# Altium schematic sheet Sheet_1_2026-11-12.schdoc
size 729 x 538 mm
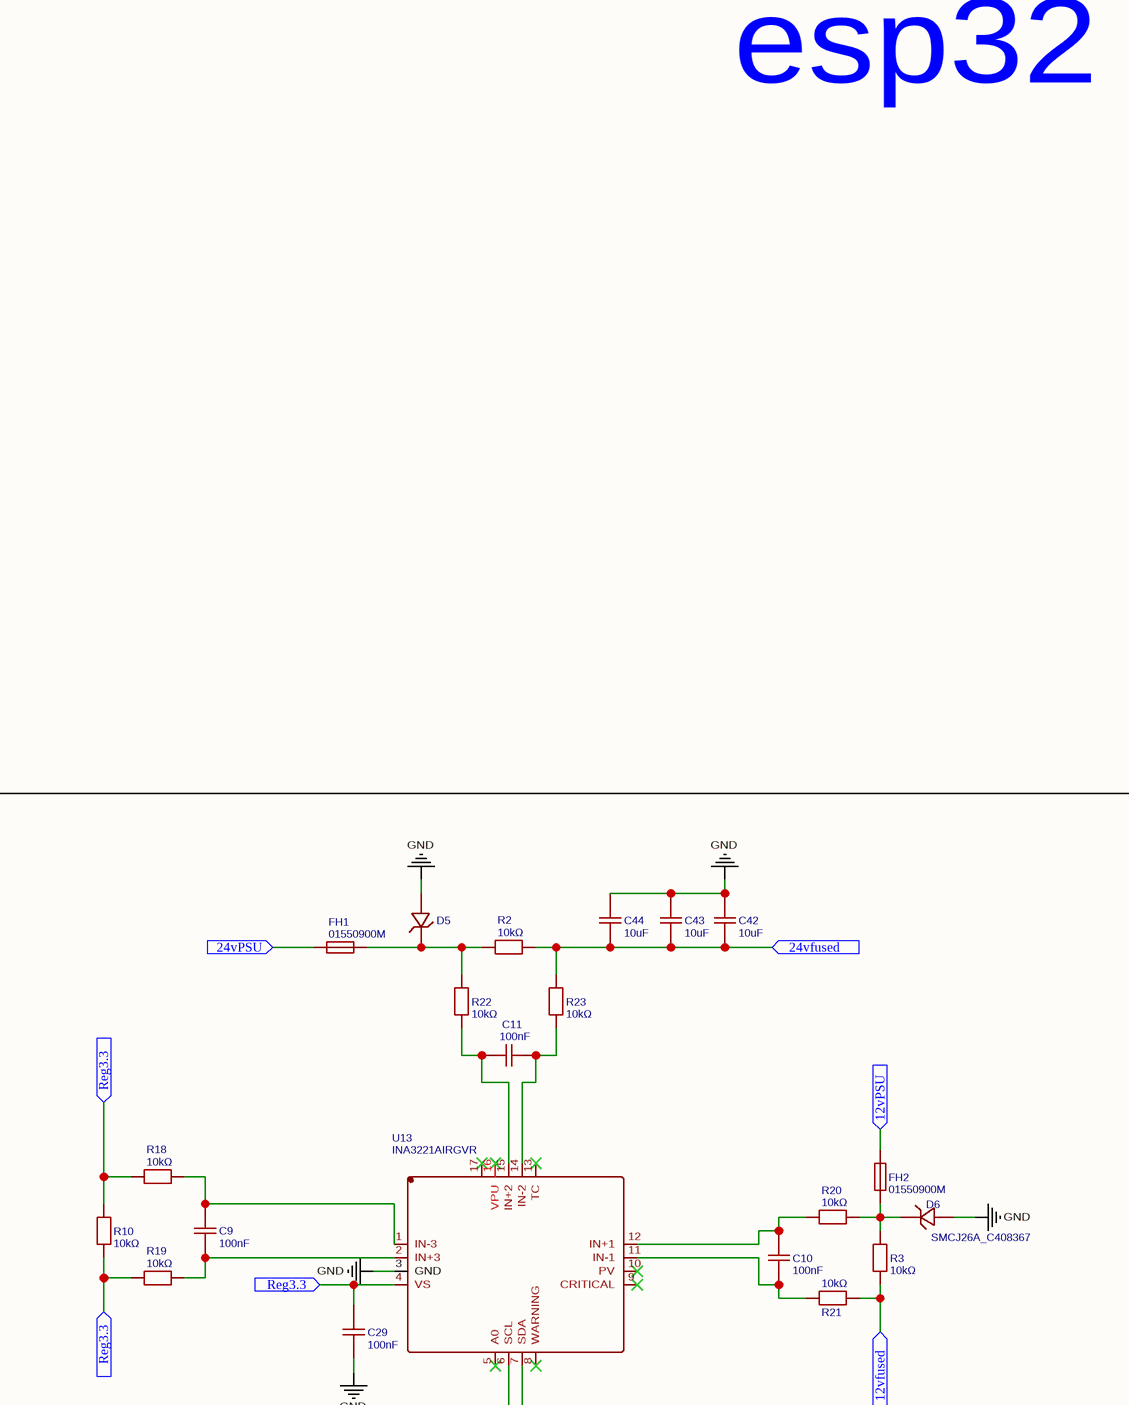
[diagram p0: Sheet_1_2026-11-12.schdoc, top left]
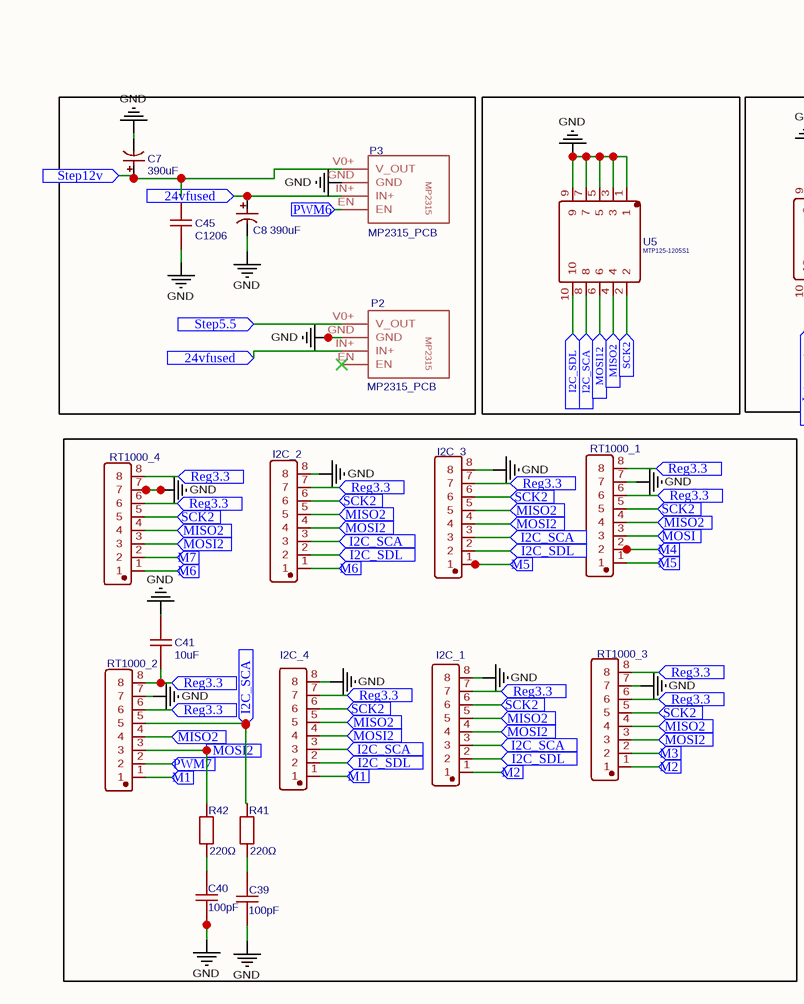
[diagram p1: Sheet_1_2026-11-12.schdoc, top middle]
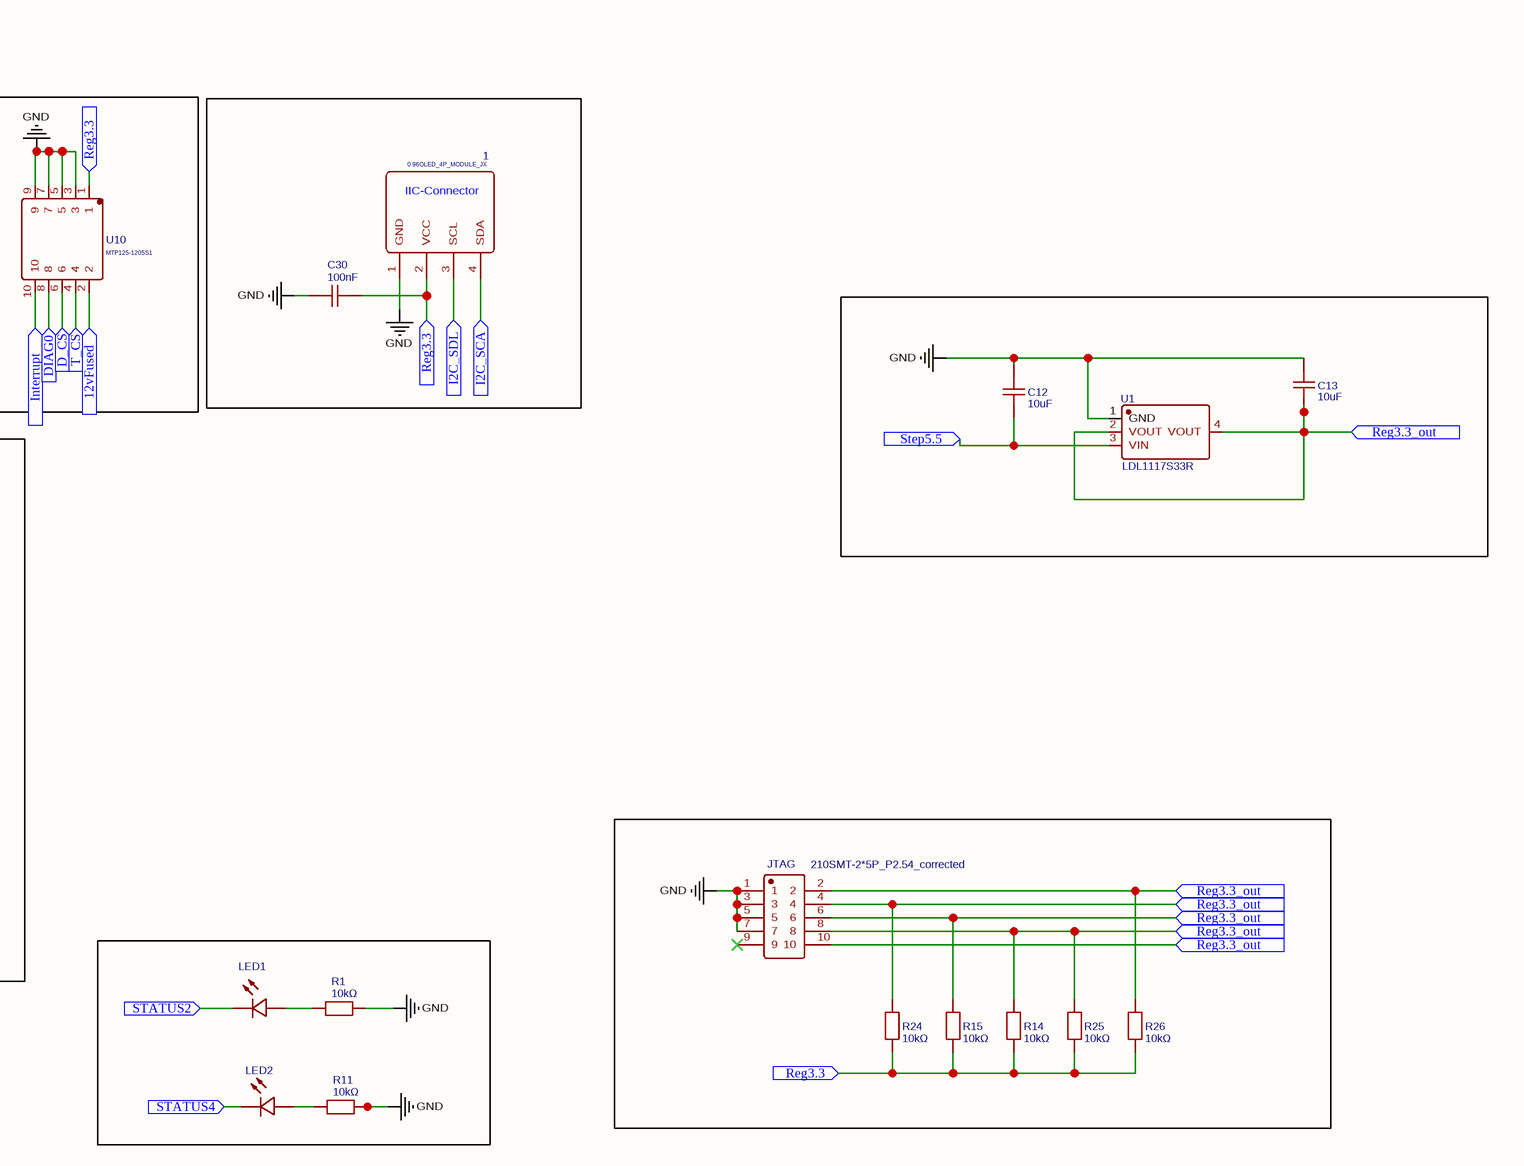
[diagram p2: Sheet_1_2026-11-12.schdoc, top right]
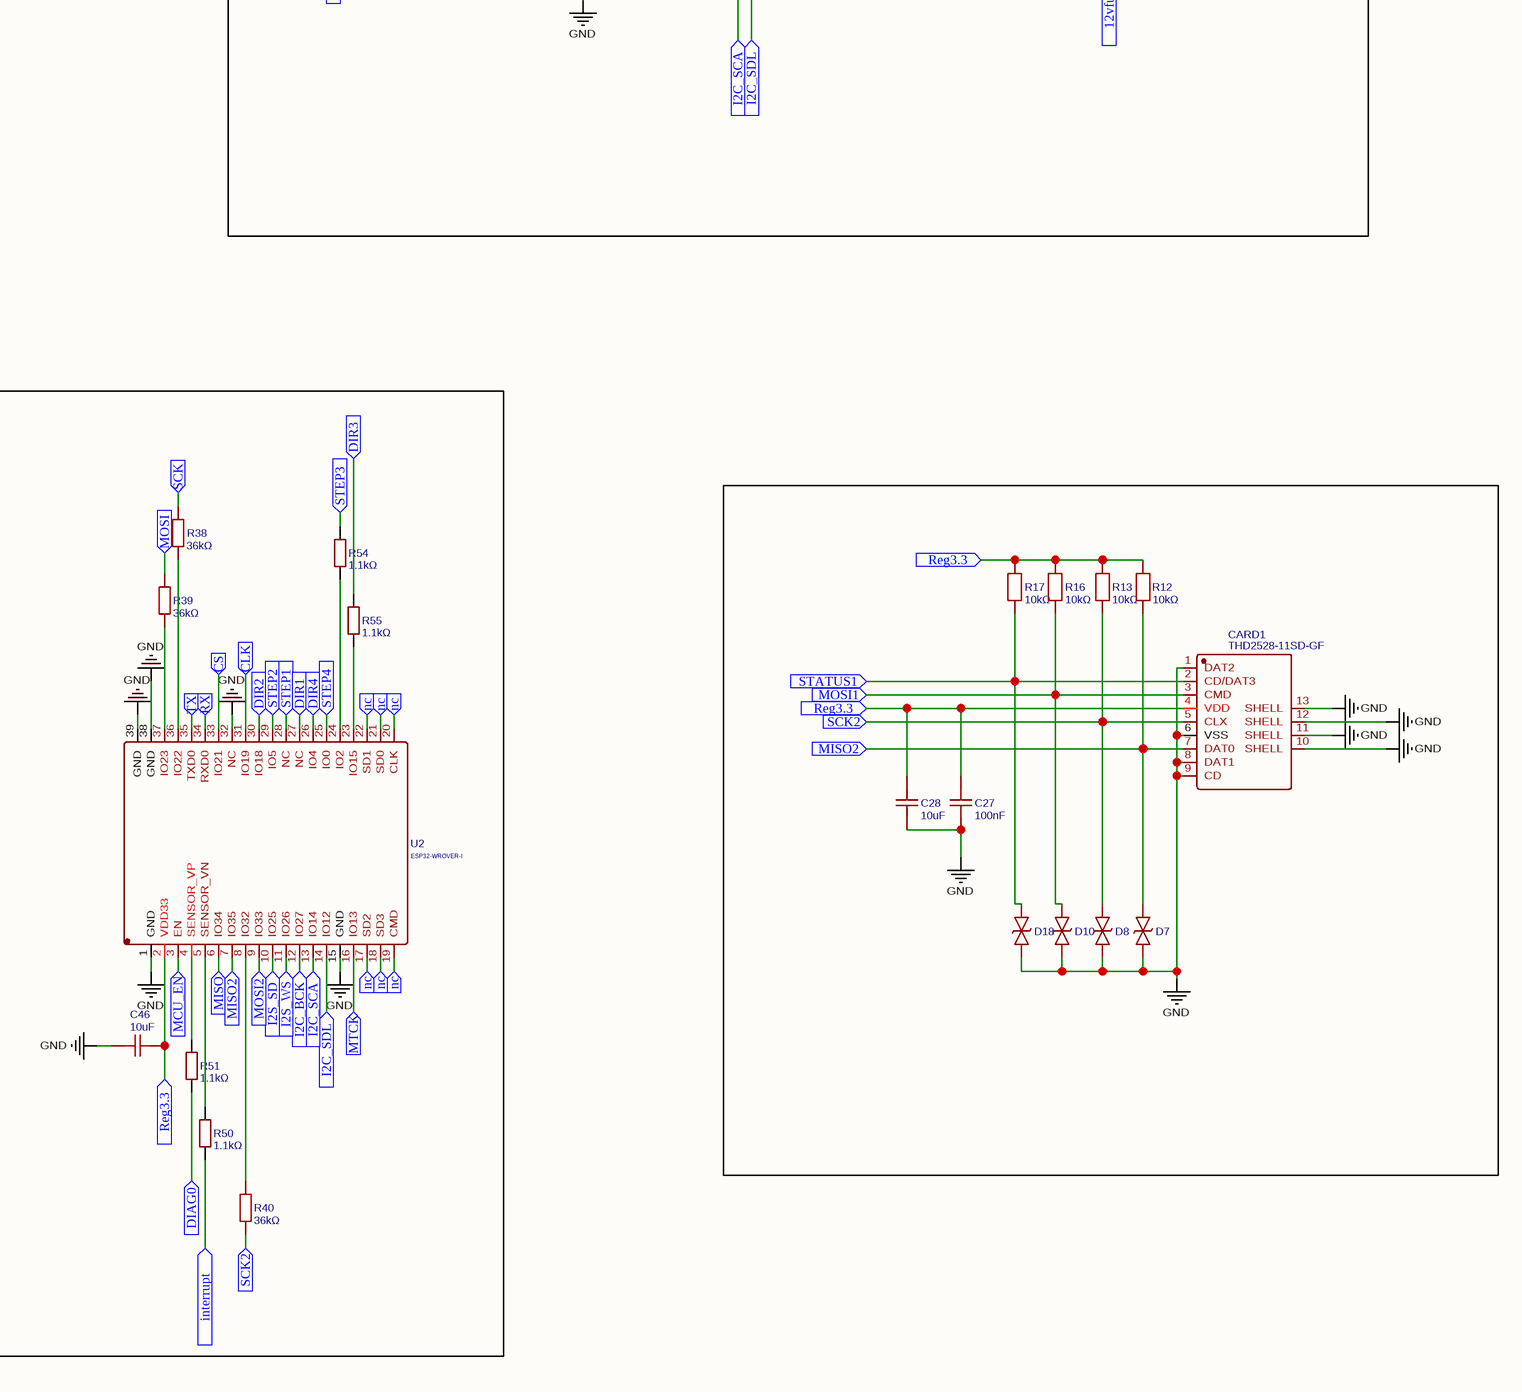
[diagram p3: Sheet_1_2026-11-12.schdoc, bottom left]
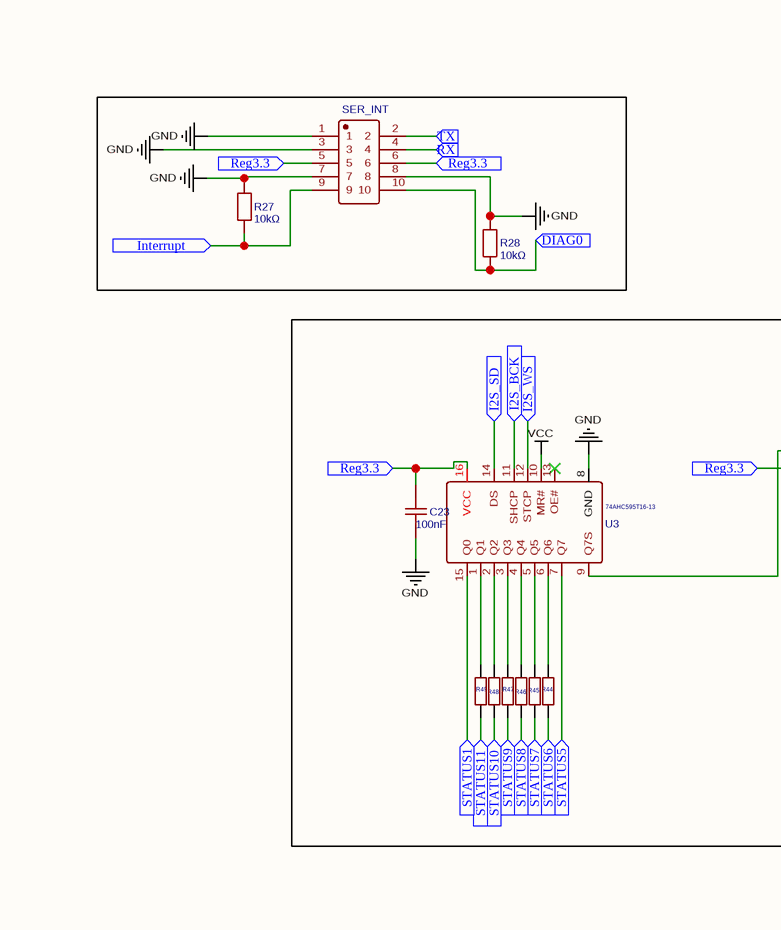
[diagram p4: Sheet_1_2026-11-12.schdoc, bottom middle]
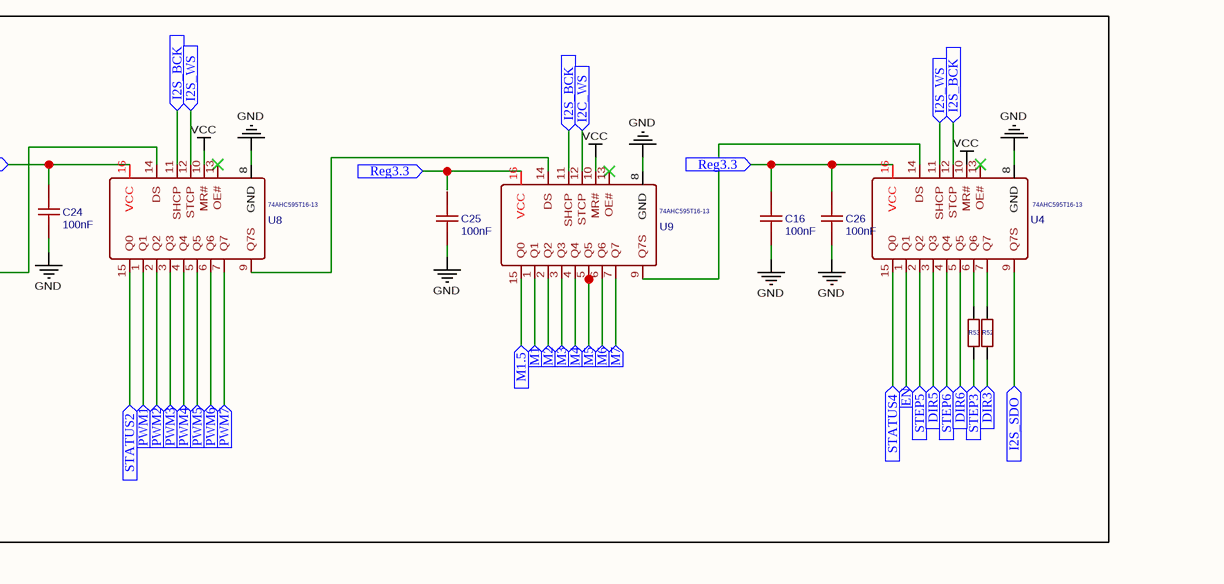
[diagram p5: Sheet_1_2026-11-12.schdoc, bottom right]

## Parts
1  0.96OLED_4P_MODULE_JX  [0.96OLED_4P]
C7  390uF  [CAP-TH_BD10.0-P5.00-D1.0-FD]
C8  390uF  [CAP-TH_BD10.0-P5.00-D1.0-FD]
C9  100nF  [C0402]
C10  100nF  [C0402]
C11  100nF  [C0402]
C12  10uF  [C1206]
C13  10uF  [C1206]
C16  100nF  [C0402]
C23  100nF  [C0402]
C24  100nF  [C0402]
C25  100nF  [C0402]
C26  100nF  [C0402]
C27  100nF  [C0402]
C28  10uF  [C0402]
C29  100nF  [C0402]
C30  100nF  [C0402]
C39  100pF  [C0402]
C40  100pF  [C0402]
C41  10uF  [C0402]
C42  10uF  [C0402]
C43  10uF  [C0402]
C44  10uF  [C0402]
C45  C1206  [C1206]
C46  10uF  [C1206]
CARD1  THD2528-11SD-GF  [TF-SMD_THD2528-11SD-GF]
D5  SMCJ26A_C408367  [SMC_L6.9-W5.9-LS7.9-RD]  (value not drawn)
D6  SMCJ26A_C408367  [SMC_L6.9-W5.9-LS7.9-RD]
D7  SMF26CA_C435495  [SOD-123_L2.8-W1.8-LS3.7-BI]  (value not drawn)
D8  SMF26CA_C435495  [SOD-123_L2.8-W1.8-LS3.7-BI]  (value not drawn)
D10  SMF26CA_C435495  [SOD-123_L2.8-W1.8-LS3.7-BI]  (value not drawn)
D18  SMF26CA_C435495  [SOD-123_L2.8-W1.8-LS3.7-BI]  (value not drawn)
FH1  01550900M  [FUSE-SMD_L9.8-W5.0_01550900M]
FH2  01550900M  [FUSE-SMD_L9.8-W5.0_01550900M]
I2C_1  MTF185-108SY1  [HDR-TH_8P-P2.54-V-F-1]  (value not drawn)
I2C_2  MTF185-108SY1  [HDR-TH_8P-P2.54-V-F-1]  (value not drawn)
I2C_3  MTF185-108SY1  [HDR-TH_8P-P2.54-V-F-1]  (value not drawn)
I2C_4  MTF185-108SY1  [HDR-TH_8P-P2.54-V-F-1]  (value not drawn)
JTAG  210SMT-2*5P_P2.54_corrected  [HDR-SMD_10P-P2.54-V-M-R2-C5-S2.54-LS7.3]
LED1  19-217/B7C-ZL2N1B3X/3T  [LED0603-R-RD_BLUE]  (value not drawn)
LED2  19-217/B7C-ZL2N1B3X/3T  [LED0603-R-RD_BLUE]  (value not drawn)
P2  MP2315_PCB  [MP2315_PCB]
P3  MP2315_PCB  [MP2315_PCB]
R1  10kΩ  [R0402]
R2  10kΩ  [R0402]
R3  10kΩ  [R0402]
R10  10kΩ  [R0402]
R11  10kΩ  [R0402]
R12  10kΩ  [R0402]
R13  10kΩ  [R0402]
R14  10kΩ  [R0402]
R15  10kΩ  [R0402]
R16  10kΩ  [R0402]
R17  10kΩ  [R0402]
R18  10kΩ  [R0402]
R19  10kΩ  [R0402]
R20  10kΩ  [R0402]
R21  10kΩ  [R0402]
R22  10kΩ  [R0402]
R23  10kΩ  [R0402]
R24  10kΩ  [R0402]
R25  10kΩ  [R0402]
R26  10kΩ  [R0402]
R27  10kΩ  [R0402]
R28  10kΩ  [R0402]
R38  36kΩ  [R0603]
R39  36kΩ  [R0603]
R40  36kΩ  [R0603]
R41  220Ω  [R0402]
R42  220Ω  [R0402]
R44  1.1kΩ  [R0402]  (value not drawn)
R45  1.1kΩ  [R0402]  (value not drawn)
R46  1.1kΩ  [R0402]  (value not drawn)
R47  1.1kΩ  [R0402]  (value not drawn)
R48  1.1kΩ  [R0402]  (value not drawn)
R49  1.1kΩ  [R0402]  (value not drawn)
R50  1.1kΩ  [R0402]
R51  1.1kΩ  [R0402]
R52  1.1kΩ  [R0402]  (value not drawn)
R53  1.1kΩ  [R0402]  (value not drawn)
R54  1.1kΩ  [R0402]
R55  1.1kΩ  [R0402]
RT1000_1  MTF185-108SY1  [HDR-TH_8P-P2.54-V-F-1]  (value not drawn)
RT1000_2  MTF185-108SY1  [HDR-TH_8P-P2.54-V-F-1]  (value not drawn)
RT1000_3  MTF185-108SY1  [HDR-TH_8P-P2.54-V-F-1]  (value not drawn)
RT1000_4  MTF185-108SY1  [HDR-TH_8P-P2.54-V-F-1]  (value not drawn)
SER_INT  210SMT-2*5P_P2.54_corrected  [HDR-SMD_10P-P2.54-V-M-R2-C5-S2.54-LS7.3]  (value not drawn)
U1  LDL1117S33R  [SOT-223-4_L6.5-W3.5-P2.30-LS7.0-BR]
U2  ESP32-WROVER-I  [WIFIM-SMD_ESP32-WROVER-I]
U3  74AHC595T16-13  [TSSOP-16_L5.0-W4.4-P0.65-LS6.4-BL]
U4  74AHC595T16-13  [TSSOP-16_L5.0-W4.4-P0.65-LS6.4-BL]
U5  MTP125-1205S1  [HDR-TH_10P-P2.54-V-M-R2-C5-S2.54]
U8  74AHC595T16-13  [TSSOP-16_L5.0-W4.4-P0.65-LS6.4-BL]
U9  74AHC595T16-13  [TSSOP-16_L5.0-W4.4-P0.65-LS6.4-BL]
U10  MTP125-1205S1  [HDR-TH_10P-P2.54-V-M-R2-C5-S2.54]
U13  INA3221AIRGVR  [QFN-16_L4.0-W4.0-P0.65-TL-EP2.2]

## Ports
12vfused (in), 12vFused (in), 12vPSU (in), 24vfused (in), 24vPSU (in), CLK (in), CS (in), D_CS (in), DIAG0 (in), DIR1 (in), DIR2 (in), DIR3 (in), DIR4 (in), DIR5 (in), DIR6 (in), EN (in), I2C_BCK (in), I2C_SCA (in), I2C_SDL (in), I2C_WS (in), I2S_BCK (in), I2S_SD (in), I2S_SDO (in), I2S_WS (in), interrupt (in), Interrupt (in), M1 (in), M1.5 (in), M2 (in), M3 (in), M4 (in), M5 (in), M6 (in), M7 (in), MCU_EN (in), MISO2 (in), MISO (in), MOSI1 (in), MOSI2 (in), MOSI12 (in), MOSI (in), MTCK (in), nc (in), PWM1 (in), PWM2 (in), PWM3 (in), PWM4 (in), PWM5 (in), PWM6 (in), PWM7 (in), Reg3.3 (in), Reg3.3_out (in), RX (in), SCK2 (in), SCK (in), STATUS1 (in), STATUS2 (in), STATUS4 (in), STATUS5 (in), STATUS6 (in), STATUS7 (in), STATUS8 (in), STATUS9 (in), STATUS10 (in), STATUS11 (in), STEP1 (in), STEP2 (in), STEP3 (in), STEP4 (in), STEP5 (in), Step5.5 (in), STEP6 (in), Step12v (in), T_CS (in), TX (in)

## Nets
GND: 1.1(GND) C7.2 C8.2 C12.2 C13.2 C16.1 C23.1 C24.1 C25.1 C26.1 C27.1 C28.2 C29.1 C30.1 C39.2 C40.2 C41.2 C42.2 C43.2 C44.2 C45.2 C46.1 CARD1.1(DAT2) CARD1.6(VSS) CARD1.8(DAT1) CARD1.9(CD) CARD1.10(SHELL) CARD1.11(SHELL) CARD1.12(SHELL) CARD1.13(SHELL) D5.2(A) D6.2(A) D7.1 D8.1 D10.1 D18.1 I2C_1.8 I2C_2.8 I2C_3.8 I2C_4.8 JTAG.1 JTAG.3 JTAG.5 JTAG.7 P2.GND P3.GND R1.2 R11.2 R27.2 R28.1 RT1000_1.7 RT1000_2.7 RT1000_3.7 RT1000_4.7 SER_INT.1 SER_INT.3 SER_INT.7 SER_INT.8 U1.1(GND) U2.1(GND) U2.15(GND) U2.32(NC) U2.38(GND) U2.39(GND) U3.8(GND) U4.8(GND) U5.1 U5.3 U5.5 U5.7 U5.9 U8.8(GND) U9.8(GND) U10.3 U10.5 U10.7 U10.9 U13.3(GND)
VCC: U3.10(MR#) U4.10(MR#) U8.10(MR#) U9.10(MR#)
12vfused: R3.2 R21.1 U10.2 ; port 12vfused, port 12vFused
12vPSU: FH2.1 ; port 12vPSU
24vfused: C8.1 C42.1 C43.1 C44.1 P2.IN+ P3.IN+ R2.2 R23.1 ; port 24vfused
24vPSU: FH1.1 ; port 24vPSU
CLK: U2.31(IO19) ; port CLK
CS: U2.33(IO21) ; port CS
D_CS: U10.6 ; port D_CS
DIAG0: R28.2 R51.1 SER_INT.10 U10.8 ; port DIAG0
DIR1: U2.27(NC) ; port DIR1
DIR2: U2.30(IO18) ; port DIR2
DIR3: R52.1 R55.2 ; port DIR3
DIR4: U2.26(IO4) ; port DIR4
DIR5: U4.3(Q3) ; port DIR5
DIR6: U4.5(Q5) ; port DIR6
EN: U4.1(Q1) ; port EN
I2C_BCK: U2.12(IO27) ; port I2C_BCK
I2C_SCA: 1.4(SDA) I2C_1.3 I2C_2.3 I2C_3.3 I2C_4.3 R41.1 RT1000_2.5 U2.13(IO14) U5.8 U13.6(SCL) ; port I2C_SCA
I2C_SDL: 1.3(SCL) I2C_1.2 I2C_2.2 I2C_3.2 I2C_4.2 U2.14(IO12) U5.10 U13.7(SDA) ; port I2C_SDL
I2C_WS: U9.12(STCP) ; port I2C_WS
I2S_BCK: U3.11(SHCP) U4.12(STCP) U8.11(SHCP) U9.11(SHCP) ; port I2S_BCK
I2S_SD: U2.10(IO25) U3.14(DS) ; port I2S_SD
I2S_SDO: U4.9(Q7S) ; port I2S_SDO
I2S_WS: U2.11(IO26) U3.12(STCP) U4.11(SHCP) U8.12(STCP) ; port I2S_WS
interrupt: R27.1 R50.1 SER_INT.9 U10.10 ; port interrupt, port Interrupt
M1: I2C_4.1 RT1000_2.1 U9.1(Q1) ; port M1
M1.5: U9.15(Q0) ; port M1.5
M2: I2C_1.1 RT1000_3.1 U9.2(Q2) ; port M2
M3: RT1000_3.2 U9.3(Q3) ; port M3
M4: RT1000_1.2 U9.4(Q4) ; port M4
M5: I2C_3.1 RT1000_1.1 U9.5(Q5) ; port M5
M6: I2C_2.1 RT1000_4.1 U9.6(Q6) ; port M6
M7: RT1000_4.2 U9.7(Q7) ; port M7
MCU_EN: U2.3(EN) ; port MCU_EN
MISO: U2.6(IO34) ; port MISO
MISO2: CARD1.7(DAT0) D7.2 I2C_1.5 I2C_2.5 I2C_3.5 I2C_4.5 R12.2 RT1000_1.4 RT1000_2.4 RT1000_3.4 RT1000_4.4 U2.7(IO35) U5.4 ; port MISO2
MOSI: R39.2 RT1000_1.3 ; port MOSI
MOSI1: CARD1.3(CMD) D10.2 R16.2 ; port MOSI1
MOSI2: I2C_1.4 I2C_2.4 I2C_3.4 I2C_4.4 R42.1 RT1000_2.3 RT1000_3.3 RT1000_4.3 U2.9(IO33) ; port MOSI2
MOSI12: U5.6 ; port MOSI12
MTCK: U2.16(IO13) ; port MTCK
nc: U2.17(SD2) U2.18(SD3) U2.19(CMD) U2.20(CLK) U2.21(SD0) U2.22(SD1) ; port nc
PWM1: U8.1(Q1) ; port PWM1
PWM2: U8.2(Q2) ; port PWM2
PWM3: U8.3(Q3) ; port PWM3
PWM4: U8.4(Q4) ; port PWM4
PWM5: U8.5(Q5) ; port PWM5
PWM6: P3.EN U8.6(Q6) ; port PWM6
PWM7: RT1000_2.2 U8.7(Q7) ; port PWM7
Reg3.3: 1.2(VCC) C16.2 C23.2 C24.2 C26.2 C27.2 C28.1 C29.2 C30.2 C41.1 C46.2 CARD1.4(VDD) I2C_1.7 I2C_2.7 I2C_3.7 I2C_4.7 R10.1 R10.2 R12.1 R13.1 R14.1 R15.1 R16.1 R17.1 R18.2 R19.2 R24.2 R25.1 R26.1 RT1000_1.6 RT1000_1.8 RT1000_2.6 RT1000_2.8 RT1000_3.6 RT1000_3.8 RT1000_4.6 RT1000_4.8 SER_INT.5 SER_INT.6 U2.2(VDD33) U3.16(VCC) U4.16(VCC) U8.16(VCC) U9.16(VCC) U10.1 U13.4(VS) ; port Reg3.3
Reg3.3_out: C13.1 JTAG.2 JTAG.4 JTAG.6 JTAG.8 JTAG.10 R14.2 R15.2 R24.1 R25.2 R26.2 U1.2(VOUT) U1.4(VOUT) ; port Reg3.3_out
RX: SER_INT.4 U2.34(RXD0) ; port RX
SCK: R38.2 ; port SCK
SCK2: CARD1.5(CLX) D8.2 I2C_1.6 I2C_2.6 I2C_3.6 I2C_4.6 R13.2 R40.1 RT1000_1.5 RT1000_3.5 RT1000_4.5 U5.2 ; port SCK2
STATUS1: CARD1.2(CD/DAT3) D18.2 R17.2 U3.15(Q0) ; port STATUS1
STATUS2: LED1.2(K) U8.15(Q0) ; port STATUS2
STATUS4: LED2.2(K) U4.15(Q0) ; port STATUS4
STATUS5: U3.7(Q7) ; port STATUS5
STATUS6: R44.1 ; port STATUS6
STATUS7: R45.1 ; port STATUS7
STATUS8: R46.1 ; port STATUS8
STATUS9: R47.1 ; port STATUS9
STATUS10: R48.1 ; port STATUS10
STATUS11: R49.1 ; port STATUS11
STEP1: U2.28(NC) ; port STEP1
STEP2: U2.29(IO5) ; port STEP2
STEP3: R53.1 R54.2 ; port STEP3
STEP4: U2.25(IO0) ; port STEP4
STEP5: U4.2(Q2) ; port STEP5
Step5.5: C12.1 P2.V0+(V_OUT) U1.3(VIN) ; port Step5.5
STEP6: U4.4(Q4) ; port STEP6
Step12v: C7.1 C45.1 P3.V0+(V_OUT) ; port Step12v
T_CS: U10.4 ; port T_CS
TX: SER_INT.2 U2.35(TXD0) ; port TX
NetC9_1: C9.1 R19.1 U13.2(IN+3)
NetC9_2: C9.2 R18.1 U13.1(IN-3)
NetC10_1: C10.1 R20.1 U13.12(IN+1)
NetC10_2: C10.2 R21.2 U13.11(IN-1)
NetC11_1: C11.1 R22.2 U13.15(IN+2)
NetC11_2: C11.2 R23.2 U13.14(IN-2)
NetC39_1: C39.1 R41.2
NetC40_1: C40.1 R42.2
NetD5_1: D5.1(C) FH1.2 R2.1 R22.1
NetD6_1: D6.1(C) FH2.2 R3.1 R20.2
NetLED1_1: LED1.1(A) R1.1
NetLED2_1: LED2.1(A) R11.1
NetR38_1: R38.1 U2.36(IO22)
NetR39_1: R39.1 U2.37(IO23)
NetR40_2: R40.2 U2.8(IO32)
NetR44_2: R44.2 U3.6(Q6)
NetR45_2: R45.2 U3.5(Q5)
NetR46_2: R46.2 U3.4(Q4)
NetR47_2: R47.2 U3.3(Q3)
NetR48_2: R48.2 U3.2(Q2)
NetR49_2: R49.2 U3.1(Q1)
NetR50_2: R50.2 U2.5(SENSOR_VN)
NetR51_2: R51.2 U2.4(SENSOR_VP)
NetR52_2: R52.2 U4.7(Q7)
NetR53_2: R53.2 U4.6(Q6)
NetR54_1: R54.1 U2.24(IO2)
NetR55_1: R55.1 U2.23(IO15)
NetU3_9: U3.9(Q7S) U8.14(DS)
NetU4_14: U4.14(DS) U9.9(Q7S)
NetU8_9: U8.9(Q7S) U9.14(DS)

Not connected (* = marked no-connect by the designer): C25 2; JTAG 9*; P2 EN*; U3 13(OE#)*; U4 13(OE#)*; U8 13(OE#)*; U9 13(OE#)*; U13 5(A0)* 8(WARNING)* 9(CRITICAL)* 10(PV)* 13(TC)* 16(VPU)* 17(PAD)*

## Notes on the sheet
- esp32 6 steeper coltroller
- (in symbol 0.96OLED_4P_MODULE_JX) IIC-Connector
- (in symbol MP2315_PCB) MP2315

## Library data of the parts
1 = 0.96OLED_4P_MODULE_JX: Manufacturer: null; Contributor: LCSC; Supplier: LCSC; Supplier Part: C9900004566; Manufacturer Part: 0.96OLED_4P_MODULE_JX; JLCPCB Part Class: Extended Part; spicePre: O; spiceSymbolName: 0.96OLED_4P_MODULE_JX
C7 C8 = 390uF: Manufacturer: AISHI(艾华集团); Manufacturer Part: ERJ1HM391G25OT; nameAlias: Value; Supplier: LCSC; Supplier Part: C106562; JLCPCB Part Class: Extended Part; spicePre: C; spiceSymbolName: ERJ1HM391G25OT
C9-C11 C16 C23-C26 C29 = 100nF: Manufacturer: YAGEO(国巨); Manufacturer Part: AC0402KRX7R9BB104; Contributor: LCSC; nameAlias: Value; Supplier: LCSC; Supplier Part: C2888326; JLCPCB Part Class: Extended Part; spicePre: C; spiceSymbolName: AC0402KRX7R9BB104
C12 C13 = 10uF: Manufacturer: YAGEO(国巨); Manufacturer Part: AC1206KKX7R5BB106; nameAlias: Value; Contributor: lcsc; Supplier: LCSC; Supplier Part: C19622857; JLCPCB Part Class: Extended Part; spicePre: U; spiceSymbolName: AC1206KKX7R5BB106
C27 = 100nF: Manufacturer: TORCH(火炬); Manufacturer Part: C0402B104K500NT; Contributor: lcsc; nameAlias: Value; Supplier: LCSC; Supplier Part: C17702730; JLCPCB Part Class: Extended Part; spicePre: C; spiceSymbolName: C0402B104K500NT
C28 C42-C44 = 10uF: Manufacturer: CCTC(三环); Manufacturer Part: TCC0402X5R106M6R3ATR; nameAlias: Value; Contributor: lcsc; Supplier: LCSC; Supplier Part: C48543727; JLCPCB Part Class: Extended Part; spicePre: C; spiceSymbolName: TCC0402X5R106M6R3ATR
C30 = 100nF: Manufacturer: HRE(芯声); Manufacturer Part: CGA0402X7R104M500GT; nameAlias: Value; Contributor: lcsc; Supplier: LCSC; Supplier Part: C36911361; JLCPCB Part Class: Extended Part; spicePre: C; spiceSymbolName: CGA0402X7R104M500GT
C39 C40 = 100pF: Manufacturer: Walsin(华新科); Manufacturer Part: MT15B101K500CT; nameAlias: Value; Contributor: LCSC; Supplier: LCSC; Supplier Part: C458946; JLCPCB Part Class: Extended Part; spicePre: C; spiceSymbolName: MT15B101K500CT
C41 = 10uF: Manufacturer: muRata(村田); Manufacturer Part: GRM155R61A106ME21D; nameAlias: Value; Contributor: LCSC; Supplier: LCSC; Supplier Part: C324476; JLCPCB Part Class: Extended Part; spicePre: C; spiceSymbolName: GRM155R61A106ME21D
C45 = C1206: Manufacturer: null; Contributor: lcsc; Supplier: LCSC; Supplier Part: C9900018280; Manufacturer Part: C1206; JLCPCB Part Class: Extended Part; spicePre: C; spiceSymbolName: C1206
C46 = 10uF: Manufacturer: CCTC(三环); Manufacturer Part: TCC1206X5R106K500HT; nameAlias: Value; Contributor: lcsc; Supplier: LCSC; Supplier Part: C5448914; JLCPCB Part Class: Extended Part; spicePre: C; spiceSymbolName: TCC1206X5R106K500HT
CARD1 = THD2528-11SD-GF: Manufacturer: THD(台华达); Contributor: LCSC; Supplier: LCSC; Supplier Part: C283232; Manufacturer Part: THD2528-11SD-GF; JLCPCB Part Class: Extended Part; spicePre: C; spiceSymbolName: THD2528-11SD-GF
D5 D6 = SMCJ26A_C408367: Manufacturer: MDD(辰达半导体); Contributor: LCSC; Supplier: LCSC; Supplier Part: C408367; Manufacturer Part: SMCJ26A; JLCPCB Part Class: Extended Part; spicePre: D; spiceSymbolName: SMCJ26A_C408367
D7 D8 D10 D18 = SMF26CA_C435495: Manufacturer: AnBon(安邦); Contributor: LCSC; Supplier: LCSC; Supplier Part: C435495; Manufacturer Part: SMF26CA; JLCPCB Part Class: Extended Part; spicePre: D; spiceSymbolName: SMF26CA_C435495
FH1 FH2 = 01550900M: Manufacturer: Littelfuse(美国力特); Contributor: LCSC; Supplier: LCSC; Supplier Part: C108518; Manufacturer Part: 01550900M; JLCPCB Part Class: Extended Part; spicePre: F; spiceSymbolName: 01550900M
I2C_1-I2C_4 RT1000_1-RT1000_4 = MTF185-108SY1: Manufacturer: MINTRON(明硕); Contributor: LCSC; Supplier: LCSC; Supplier Part: C358722; Manufacturer Part: MTF185-108SY1; JLCPCB Part Class: Extended Part; spicePre: H; spiceSymbolName: MTF185-108SY1
JTAG SER_INT = 210SMT-2*5P_P2.54_corrected: Manufacturer: Ckmtw; Contributor: cherepnin1; Supplier: LCSC; Manufacturer Part: 210SMT-2*5P_P2.54; Supplier Part: C124391; JLCPCB Part Class: Extended Part; spicePre: H; spiceSymbolName: 210SMT-2*5P_P2.54_corrected
LED1 LED2 = 19-217/B7C-ZL2N1B3X/3T: Manufacturer: EVERLIGHT(亿光); Contributor: LCSC; Supplier: LCSC; Supplier Part: C264466; Manufacturer Part: 19-217/B7C-ZL2N1B3X/3T; JLCPCB Part Class: Extended Part; spicePre: L; spiceSymbolName: 19-217/B7C-ZL2N1B3X/3T
P2 P3 = MP2315_PCB: Contributor: ph1w21; spicePre: ?; spiceSymbolName: MP2315_PCB
R1 R11 = 10kΩ: Manufacturer: RESI(开步睿思); Manufacturer Part: PTFR0402Q10K0N9; nameAlias: Value; Contributor: lcsc; Supplier: LCSC; Supplier Part: C52677569; JLCPCB Part Class: Extended Part; spicePre: R; spiceSymbolName: PTFR0402Q10K0N9
R2 R3 R10 R12-R28 = 10kΩ: Manufacturer: PANASONIC(松下); Manufacturer Part: ERJ2RKF103X; nameAlias: Value; Contributor: LCSC; Supplier: LCSC; Supplier Part: C416461; JLCPCB Part Class: Extended Part; spicePre: R; spiceSymbolName: ERJ2RKF103X
R38-R40 = 36kΩ: Manufacturer: KOA; Manufacturer Part: RK73H1JTTD3602F; nameAlias: Value; Contributor: LCSC; Supplier: LCSC; Supplier Part: C220707; JLCPCB Part Class: Extended Part; spicePre: R; spiceSymbolName: RK73H1JTTD3602F
R41 R42 = 220Ω: Manufacturer: UNI-ROYAL(厚声); Manufacturer Part: 0402WGD2200TCE; nameAlias: Value; Contributor: LCSC; Supplier: LCSC; Supplier Part: C407744; JLCPCB Part Class: Extended Part; spicePre: R; spiceSymbolName: 0402WGD2200TCE
R44-R55 = 1.1kΩ: Manufacturer: YAGEO(国巨); Manufacturer Part: RC0402FR-071K1L; nameAlias: Value; Supplier: LCSC; Supplier Part: C138041; JLCPCB Part Class: Extended Part; spicePre: R; spiceSymbolName: RC0402FR-071K1L
U1 = LDL1117S33R: Manufacturer: ST(意法半导体); Contributor: LCSC; Supplier: LCSC; Supplier Part: C435835; Manufacturer Part: LDL1117S33R; JLCPCB Part Class: Extended Part; spicePre: U; spiceSymbolName: LDL1117S33R
U2 = ESP32-WROVER-I: Manufacturer: ESPRESSIF(乐鑫); Contributor: LCSC; Supplier: LCSC; Supplier Part: C132370; Manufacturer Part: ESP32-WROVER-I; JLCPCB Part Class: Extended Part; spicePre: U; spiceSymbolName: ESP32-WROVER-I
U3 U4 U8 U9 = 74AHC595T16-13: Manufacturer: DIODES(美台); Contributor: LCSC; Supplier: LCSC; Supplier Part: C460496; Manufacturer Part: 74AHC595T16-13; JLCPCB Part Class: Extended Part; spicePre: U; spiceSymbolName: 74AHC595T16-13
U5 U10 = MTP125-1205S1: Manufacturer: MINTRON(明硕); Contributor: LCSC; Supplier: LCSC; Supplier Part: C358694; Manufacturer Part: MTP125-1205S1; JLCPCB Part Class: Extended Part; spicePre: U; spiceSymbolName: MTP125-1205S1
U13 = INA3221AIRGVR: Manufacturer: TI(德州仪器); Contributor: LCSC; Supplier: LCSC; Supplier Part: C181255; Manufacturer Part: INA3221AIRGVR; JLCPCB Part Class: Extended Part; spicePre: U; spiceSymbolName: INA3221AIRGVR